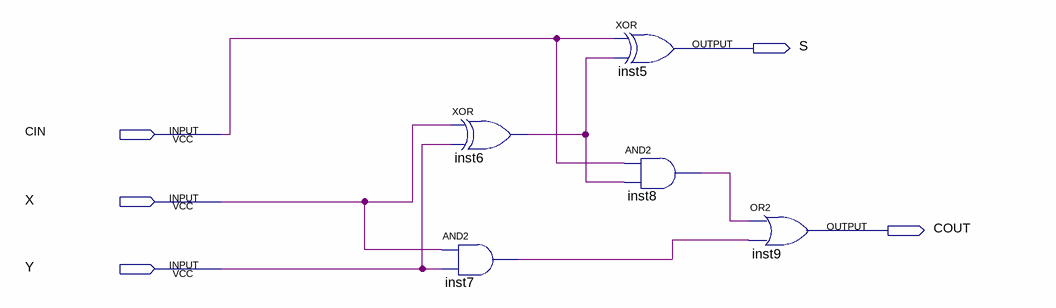
[diagram p0: schematic sheet]
// Quartus schematic aula_05.bdf as structural Verilog: 5 symbols, 5 pins
module aula_05 (
  input  CIN,
  input  X,
  input  Y,
  output S,
  output COUT
);

  wire inst6_out, inst7_out, inst8_out;

  xor inst6 (inst6_out, X, Y);
  and inst7 (inst7_out, X, Y);
  xor inst5 (S, CIN, inst6_out);
  and inst8 (inst8_out, CIN, inst6_out);
  or inst9 (COUT, inst8_out, inst7_out);
endmodule
